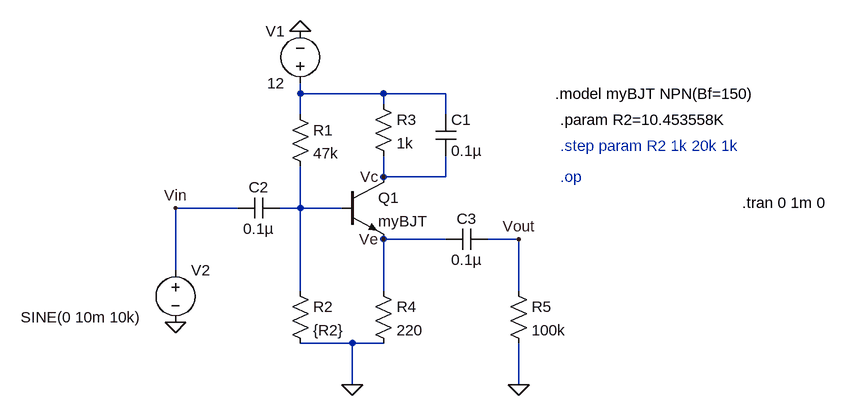
[diagram p0: schematic E5.asc]
E5.asc, the LTspice schematic file:
Version 4.1
SHEET 1 1048 680
WIRE 208 160 208 144
WIRE 336 160 208 160
WIRE 432 160 336 160
WIRE 336 176 336 160
WIRE 208 192 208 160
WIRE 432 192 432 160
WIRE 336 288 336 256
WIRE 432 288 432 256
WIRE 432 288 336 288
WIRE 112 336 16 336
WIRE 208 336 208 272
WIRE 208 336 176 336
WIRE 272 336 208 336
WIRE 432 384 336 384
WIRE 544 384 496 384
WIRE 16 432 16 336
WIRE 208 464 208 336
WIRE 336 464 336 384
WIRE 544 464 544 384
WIRE 288 544 208 544
WIRE 336 544 288 544
WIRE 288 608 288 544
WIRE 544 608 544 544
FLAG 16 512 0
FLAG 208 64 0
FLAG 288 608 0
FLAG 544 608 0
FLAG 336 288 Vc
FLAG 336 384 Ve
FLAG 16 336 Vin
FLAG 544 384 Vout
SYMBOL voltage 208 160 R180
WINDOW 0 24 96 Left 2
WINDOW 3 24 16 Left 2
WINDOW 123 0 0 Left 0
WINDOW 39 0 0 Left 0
SYMATTR InstName V1
SYMATTR Value 12
SYMBOL res 192 176 R0
SYMATTR InstName R1
SYMATTR Value 47k
SYMBOL res 320 160 R0
SYMATTR InstName R3
SYMATTR Value 1k
SYMBOL cap 416 192 R0
SYMATTR InstName C1
SYMATTR Value 0.1µ
SYMBOL npn 272 288 R0
SYMATTR InstName Q1
SYMATTR Value myBJT
SYMBOL cap 176 320 R90
WINDOW 0 0 32 VBottom 2
WINDOW 3 32 32 VTop 2
SYMATTR InstName C2
SYMATTR Value 0.1µ
SYMBOL voltage 16 416 R0
WINDOW 3 -238 88 Left 2
WINDOW 123 0 0 Left 0
WINDOW 39 0 0 Left 0
SYMATTR InstName V2
SYMATTR Value SINE(0 10m 10k)
SYMBOL res 192 448 R0
SYMATTR InstName R2
SYMATTR Value {R2}
SYMBOL res 320 448 R0
SYMATTR InstName R4
SYMATTR Value 220
SYMBOL res 528 448 R0
SYMATTR InstName R5
SYMATTR Value 100k
SYMBOL cap 496 368 R90
WINDOW 0 0 32 VBottom 2
WINDOW 3 32 32 VTop 2
SYMATTR InstName C3
SYMATTR Value 0.1µ
TEXT 600 160 Left 2 !.model myBJT NPN(Bf=150)
TEXT 608 200 Left 2 !.param R2=10.453558K
TEXT 608 240 Left 2 ;.step param R2 1k 20k 1k
TEXT 608 288 Left 2 ;.op
TEXT 888 328 Left 2 !.tran 0 1m 0

The netlist it stands for:
* E5.asc
V1 N001 0 12
R1 N001 N002 47k
R3 N001 Vc 1k
C1 N001 Vc 0.1µ
Q1 Vc N002 Ve 0 myBJT
C2 N002 Vin 0.1µ
V2 Vin 0 SINE(0 10m 10k)
R2 N002 0 {R2}
R4 Ve 0 220
R5 Vout 0 100k
C3 Vout Ve 0.1µ
.model NPN NPN
.model PNP PNP
.lib standard.bjt
.model myBJT NPN(Bf=150)
.param R2=10.453558K
* .step param R2 1k 20k 1k
* .op
.tran 0 1m 0
.backanno
.end